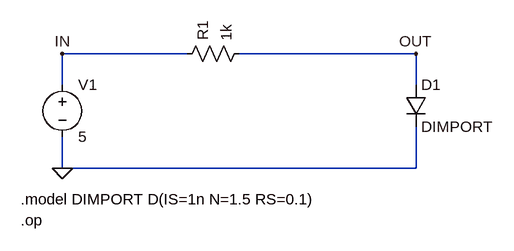
[diagram p0: schematic ltspice-selfcontained-diode.asc]
ltspice-selfcontained-diode.asc, the LTspice schematic file:
Version 4
SHEET 1 1120 720
WIRE 352 192 160 192
WIRE 704 192 432 192
WIRE 160 240 160 192
WIRE 704 240 704 192
WIRE 160 368 160 320
WIRE 704 368 704 304
WIRE 704 368 160 368
FLAG 160 192 IN
FLAG 704 192 OUT
FLAG 160 368 0
SYMBOL voltage 160 224 R0
SYMATTR InstName V1
SYMATTR Value 5
SYMBOL res 336 208 R270
SYMATTR InstName R1
SYMATTR Value 1k
SYMBOL diode 688 240 R0
SYMATTR InstName D1
SYMATTR Value DIMPORT
TEXT 96 416 Left 2 !.model DIMPORT D(IS=1n N=1.5 RS=0.1)
TEXT 96 448 Left 2 !.op

The netlist it stands for:
* ltspice-selfcontained-diode.asc
V1 IN 0 5
R1 IN OUT 1k
D1 OUT 0 DIMPORT
.model D D
.lib standard.dio
.model DIMPORT D(IS=1n N=1.5 RS=0.1)
.op
.backanno
.end